# Altium schematic sheet mPCIe_Connector_Sheet.SchDoc
size A4; SheetNumber: 8; SheetTotal: 8
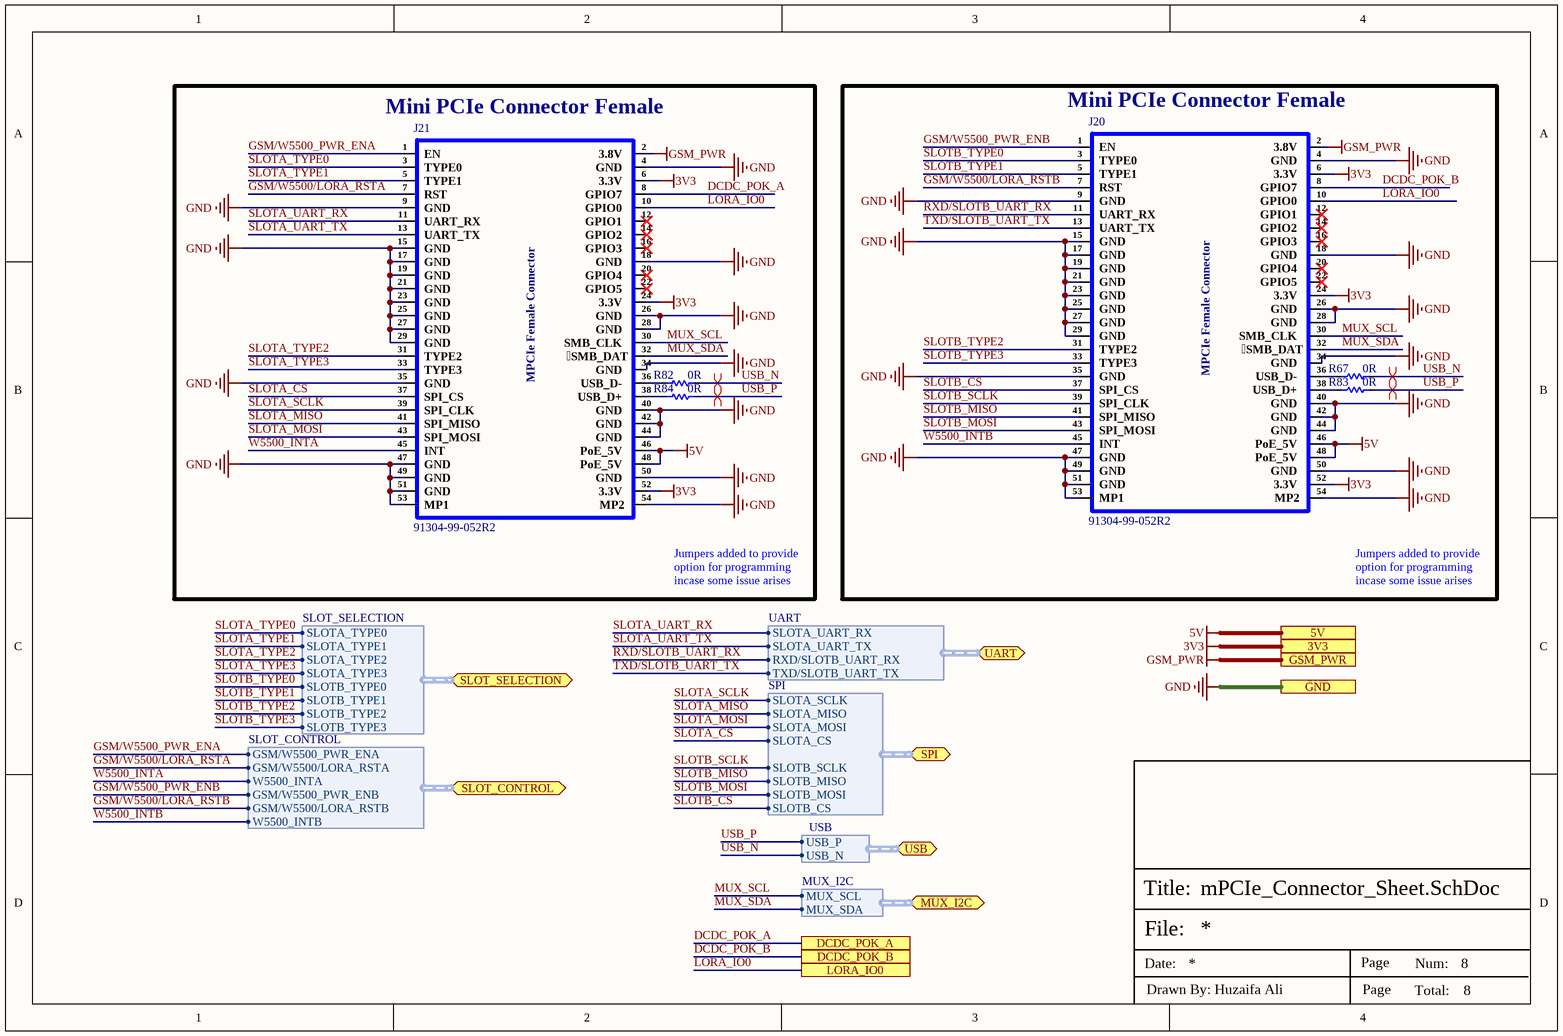
[diagram p0: mPCIe_Connector_Sheet.SchDoc]

## Parts
J20  91304-99-052R2  [91304-99-052R2]
J21  91304-99-052R2  [91304-99-052R2]
R67  0R  [Res-0402]
R82  0R  [Res-0402]
R83  0R  [Res-0402]
R84  0R  [Res-0402]

## Blocks framed on the sheet
Mini PCIe Connector Female: J21 R82 R84
Mini PCIe Connector Female: J20 R67 R83

## Ports
3V3, 5V, DCDC_POK_A, DCDC_POK_B, GND, GSM_PWR, LORA_IO0, MUX_I2C (bidir, harness MUX_I2C), SLOT_CONTROL (bidir, harness SLOT_CONTROL), SLOT_SELECTION (bidir, harness SLOT_SELECTION), SPI (bidir, harness SPI), UART (bidir, harness UART), USB (bidir, harness USB)

## Harnesses
SLOT_SELECTION: SLOTA_TYPE0, SLOTA_TYPE1, SLOTA_TYPE2, SLOTA_TYPE3, SLOTB_TYPE0, SLOTB_TYPE1, SLOTB_TYPE2, SLOTB_TYPE3
SLOT_CONTROL: GSM/W5500_PWR_ENA, GSM/W5500/LORA_RSTA, W5500_INTA, GSM/W5500_PWR_ENB, GSM/W5500/LORA_RSTB, W5500_INTB
MUX_I2C: MUX_SCL, MUX_SDA
UART: RXD/SLOTB_UART_RX, SLOTA_UART_RX, TXD/SLOTB_UART_TX, SLOTA_UART_TX
USB: USB_P, USB_N
SPI: SLOTA_SCLK, SLOTA_MISO, SLOTA_MOSI, SLOTA_CS, SLOTB_SCLK, SLOTB_MISO, SLOTB_MOSI, SLOTB_CS

## Nets
3V3: J20.6(3.3V) J20.24(3.3V) J20.52(3.3V) J21.6(3.3V) J21.24(3.3V) J21.52(3.3V) ; port 3V3
5V: J20.46(PoE_5V) J20.48(PoE_5V) J21.46(PoE_5V) J21.48(PoE_5V) ; port 5V
GND: J20.4(GND) J20.9(GND) J20.15(GND) J20.17(GND) J20.18(GND) J20.19(GND) J20.21(GND) J20.23(GND) J20.25(GND) J20.26(GND) J20.27(GND) J20.28(GND) J20.29(GND) J20.34(GND) J20.35(GND) J20.40(GND) J20.42(GND) J20.44(GND) J20.47(GND) J20.49(GND) J20.50(GND) J20.51(GND) J20.53(MP1) J20.54(MP2) J21.4(GND) J21.9(GND) J21.15(GND) J21.17(GND) J21.18(GND) J21.19(GND) J21.21(GND) J21.23(GND) J21.25(GND) J21.26(GND) J21.27(GND) J21.28(GND) J21.29(GND) J21.34(GND) J21.35(GND) J21.40(GND) J21.42(GND) J21.44(GND) J21.47(GND) J21.49(GND) J21.50(GND) J21.51(GND) J21.53(MP1) J21.54(MP2) ; port GND
GSM_PWR: J20.2(3.8V) J21.2(3.8V) ; port GSM_PWR
DCDC_POK_A: J21.8(GPIO7) ; port DCDC_POK_A
DCDC_POK_B: J20.8(GPIO7) ; port DCDC_POK_B
GSM/W5500/LORA_RSTA: J21.7(RST) ; port SLOT_CONTROL.GSM/W5500/LORA_RSTA
GSM/W5500/LORA_RSTB: J20.7(RST) ; port SLOT_CONTROL.GSM/W5500/LORA_RSTB
GSM/W5500_PWR_ENA: J21.1(EN) ; port SLOT_CONTROL.GSM/W5500_PWR_ENA
GSM/W5500_PWR_ENB: J20.1(EN) ; port SLOT_CONTROL.GSM/W5500_PWR_ENB
LORA_IO0: J20.10(GPIO0) J21.10(GPIO0) ; port LORA_IO0
MUX_SCL: J20.30(SMB_CLK) J21.30(SMB_CLK) ; port MUX_I2C.MUX_SCL
MUX_SDA: J20.32(SMB_DAT) J21.32(SMB_DAT) ; port MUX_I2C.MUX_SDA
RXD/SLOTB_UART_RX: J20.11(UART_RX) ; port UART.RXD/SLOTB_UART_RX
SLOTA_CS: J21.37(SPI_CS) ; port SPI.SLOTA_CS
SLOTA_MISO: J21.41(SPI_MISO) ; port SPI.SLOTA_MISO
SLOTA_MOSI: J21.43(SPI_MOSI) ; port SPI.SLOTA_MOSI
SLOTA_SCLK: J21.39(SPI_CLK) ; port SPI.SLOTA_SCLK
SLOTA_TYPE0: J21.3(TYPE0) ; port SLOT_SELECTION.SLOTA_TYPE0
SLOTA_TYPE1: J21.5(TYPE1) ; port SLOT_SELECTION.SLOTA_TYPE1
SLOTA_TYPE2: J21.31(TYPE2) ; port SLOT_SELECTION.SLOTA_TYPE2
SLOTA_TYPE3: J21.33(TYPE3) ; port SLOT_SELECTION.SLOTA_TYPE3
SLOTA_UART_RX: J21.11(UART_RX) ; port UART.SLOTA_UART_RX
SLOTA_UART_TX: J21.13(UART_TX) ; port UART.SLOTA_UART_TX
SLOTB_CS: J20.37(SPI_CS) ; port SPI.SLOTB_CS
SLOTB_MISO: J20.41(SPI_MISO) ; port SPI.SLOTB_MISO
SLOTB_MOSI: J20.43(SPI_MOSI) ; port SPI.SLOTB_MOSI
SLOTB_SCLK: J20.39(SPI_CLK) ; port SPI.SLOTB_SCLK
SLOTB_TYPE0: J20.3(TYPE0) ; port SLOT_SELECTION.SLOTB_TYPE0
SLOTB_TYPE1: J20.5(TYPE1) ; port SLOT_SELECTION.SLOTB_TYPE1
SLOTB_TYPE2: J20.31(TYPE2) ; port SLOT_SELECTION.SLOTB_TYPE2
SLOTB_TYPE3: J20.33(TYPE3) ; port SLOT_SELECTION.SLOTB_TYPE3
TXD/SLOTB_UART_TX: J20.13(UART_TX) ; port UART.TXD/SLOTB_UART_TX
USB_N: R67.2 R82.2 ; port USB.USB_N
USB_P: R83.2 R84.2 ; port USB.USB_P
W5500_INTA: J21.45(INT) ; port SLOT_CONTROL.W5500_INTA
W5500_INTB: J20.45(INT) ; port SLOT_CONTROL.W5500_INTB
NetJ20_36: J20.36(USB_D-) R67.1
NetJ20_38: J20.38(USB_D+) R83.1
NetJ21_36: J21.36(USB_D-) R82.1
NetJ21_38: J21.38(USB_D+) R84.1

Not connected (* = marked no-connect by the designer): J20 12(GPIO1)* 14(GPIO2)* 16(GPIO3)* 20(GPIO4)* 22(GPIO5)*; J21 12(GPIO1)* 14(GPIO2)* 16(GPIO3)* 20(GPIO4)* 22(GPIO5)*

## Layout directives
differential pair: USB_N, USB_P

## Notes on the sheet
- Jumpers added to provide option for programming incase some issue arises
- File:
- Title:
- Date:
- Page
- Num:
- Total:
- Drawn By: Huzaifa Ali
- (in symbol 91304-99-052R2) MPCIe Female Connector

## Library data of the parts
J20 J21 = 91304-99-052R2: 0.8mm mPCI-E Surface Mount 52 SMD,P=0.8mm Card Edge Connectors ROHS; Manufacturer: UMAX; Item Type: mPCI-E Connector; Manufacturer Part Number: 91304-99-052R2; ComponentLink1Description: LCSC; ComponentLink1URL: https://www.lcsc.com/product-detail/Card-Edge-Connectors_UMAX-91304-99-052R2_C404126.html; Package: SMD,P=0.8mm; LCSC Part Number: C404126
R67 R82-R84 = RC0402FR-070RL: RES 0 OHM JUMPER 1/16W 0402; Manufacturer: Yageo; Tolerance: 1%; Power Rating: 62.5mW; Voltage Rating: 50V; Temperature Coefficient: 200ppm/°C; Max Power Dissipation: 63mW; Supplier 1: Mouser; Manufacturer Part Number: RC0402FR-070RL; RoHS: Yes; Category: Chip SMD Resistors; Stock 1: 8556842; Pricing 1: 1=0.10000, 10=0.01400, 50=0.01400, 100=0.00600, 1000=0.00300, 5000=0.00200, 10000=0.00100 (USD); Mount: Surface Mount; Case/Package: 0402; Contact Plating: Tin,Matte; Case Code (Imperial): 0402; Case Code (Metric): 1005; Size Code: 0402; Min Operating Temperature: -55°C; Max Operating Temperature: 155°C; Resistance: 0R; Resistor Type: Thick Film; Packaging: Tape and Reel; Termination: SMD/SMT; Features: Moisture Resistant; Series: RC; Number of Terminations: 2; Length: 1mm; Width: 0.5mm; Height: 0.35mm; Radiation Hardening: No; Lead Free: Lead Free; RoHS Compliant: Yes; ComponentLink1URL: https://datasheet.ciiva.com/8896/pyu-rc0402-51-rohs-l-6-8896149.pdf?src-supplier=Avnet; ComponentLink1Description: https://datasheet.ciiva.com/8896/pyu-rc0402-51-rohs-l-6-8896149.pdf?src-supplier=Avnet; ComponentLink2URL: https://datasheet.ciiva.com/16790/pyu-rc0402-51-rohs-l-6-r-16790444.pdf?src-supplier=Future+Electronics; ComponentLink2Description: https://datasheet.ciiva.com/16790/pyu-rc0402-51-rohs-l-6-r-16790444.pdf?src-supplier=Future+Electronics; Supplier Part Number 1: 603-RC0402FR-070RL; LCSC Part Number: C106231